# Altium schematic sheet Microcontroller.SchDoc
size A
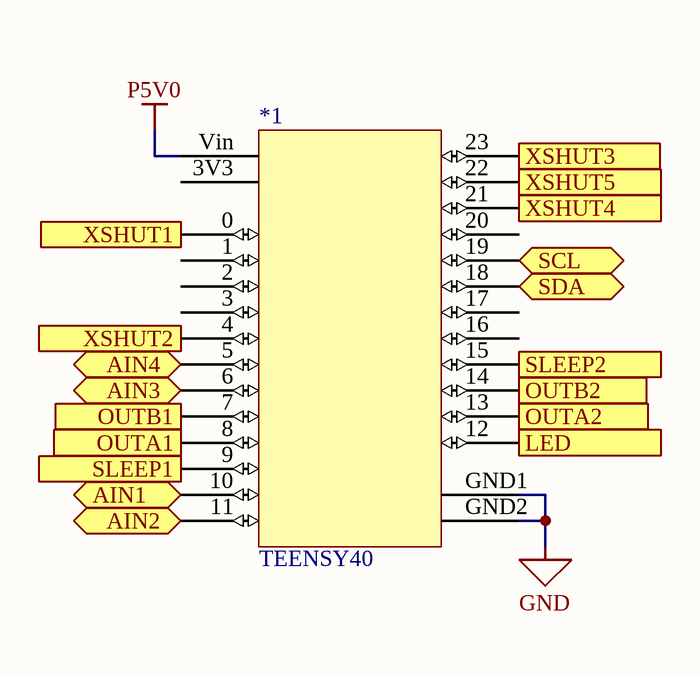
[diagram p0: Microcontroller.SchDoc]

## Parts
*1  TEENSY40  [TEENSY40-Footprint-1]

## Ports
AIN1 (bidir), AIN2 (bidir), AIN3 (bidir), AIN4 (bidir), LED (out), OUTA1 (in), OUTA2 (in), OUTB1 (in), OUTB2 (in), SCL (bidir), SDA (bidir), SLEEP1 (out), SLEEP2 (out), XSHUT1 (out), XSHUT2 (out), XSHUT3 (out), XSHUT4 (out), XSHUT5 (out)

## Nets
GND: *1.GND1(GND) *1.GND2(GND)
P5V0: *1.Vin
AIN1: *1.10 ; port AIN1
AIN2: *1.11 ; port AIN2
AIN3: *1.6 ; port AIN3
AIN4: *1.5 ; port AIN4
LED: *1.12 ; port LED
OUTA1: *1.8 ; port OUTA1
OUTA2: *1.13 ; port OUTA2
OUTB1: *1.7 ; port OUTB1
OUTB2: *1.14 ; port OUTB2
SCL: *1.19 ; port SCL
SDA: *1.18 ; port SDA
SLEEP1: *1.9 ; port SLEEP1
SLEEP2: *1.15 ; port SLEEP2
XSHUT1: *1.0 ; port XSHUT1
XSHUT2: *1.4 ; port XSHUT2
XSHUT3: *1.23 ; port XSHUT3
XSHUT4: *1.21 ; port XSHUT4
XSHUT5: *1.22 ; port XSHUT5

Not connected (* = marked no-connect by the designer): *1 1 2 3 3V3 16 17 20

## Library data of the parts
*1 = CMP-020-00024-3: PJRC Teensy 4.0 USB Development Board